# EAGLE design Bracelet_PCB_v2.0 (EAGLE 8.2.0)

## Sheet 1 of 2
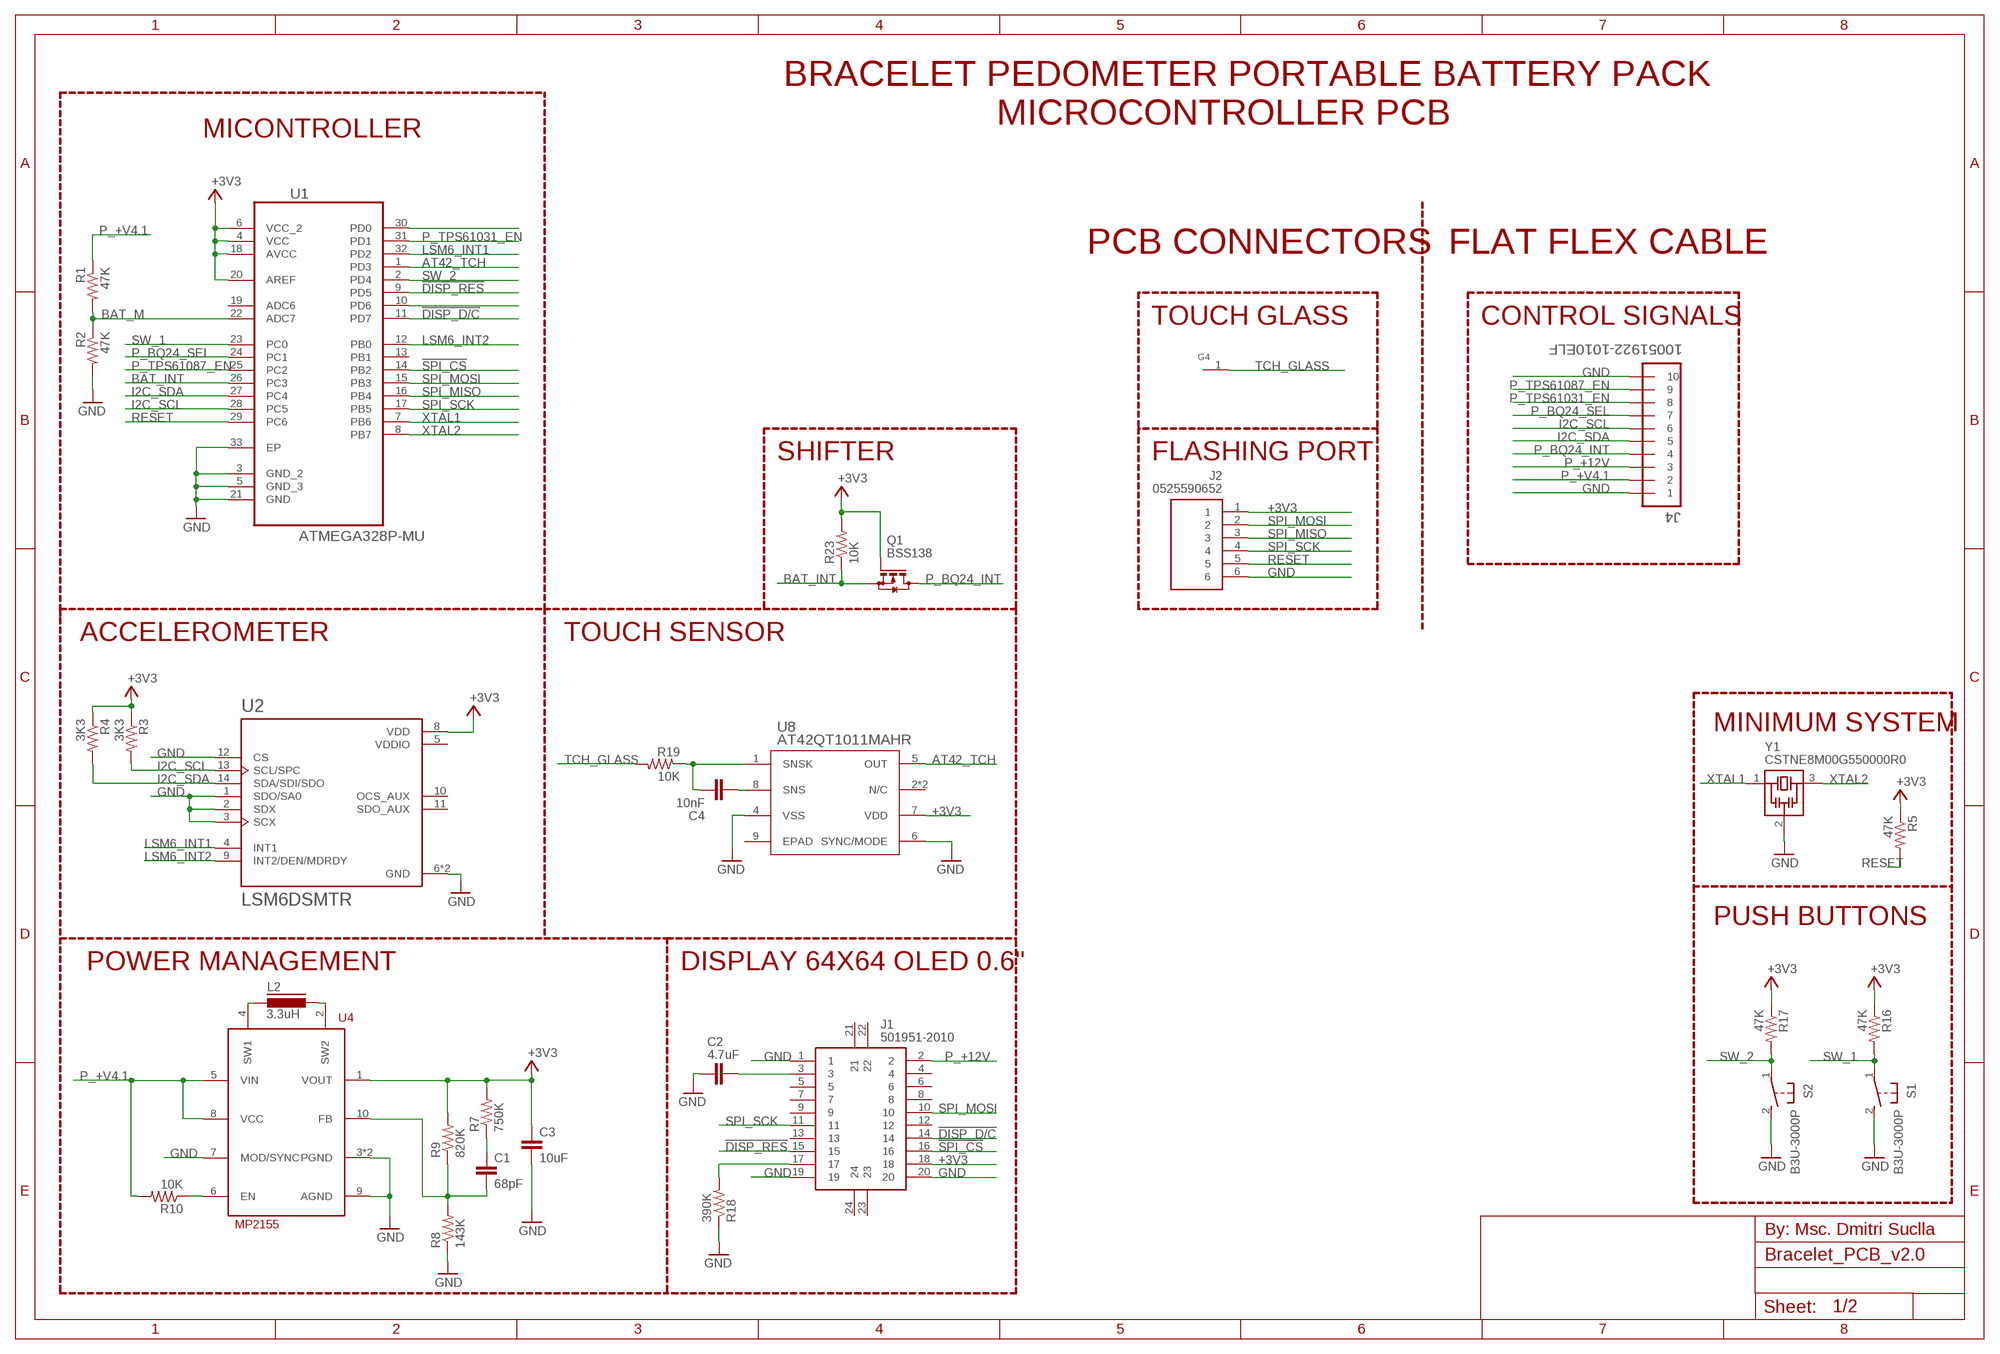
[diagram p0: schematic, sheet 1]

### Parts
C1  68pF  C-EUC0201  [C0201]
C2  4.7uF  C-EUC0402  [C0402]
C3  10uF  C-EUC0603  [C0603]
C4  10nF  C-EUC0201  [C0201]
G4  TOUCH_GLASS  [TOUCH_GLASS]
J1  501951-2010  [5019512010]
J2  0525590652  [0525590652]
J4  10051922-1010ELF  [FCI_10051922-1010ELF]
L2  3.3uH  MBKK1608T3R3M  [0603(1608)]
Q1  BSS138  [SOT23]
R1  47K  R-US_R0201  [R0201]
R2  47K  R-US_R0201  [R0201]
R3  3K3  R-US_R0201  [R0201]
R4  3K3  R-US_R0201  [R0201]
R5  47K  R-US_R0201  [R0201]
R7  750K  R-US_R0201  [R0201]
R8  143K  R-US_R0201  [R0201]
R9  820K  R-US_R0201  [R0201]
R10  10K  R-US_R0201  [R0201]
R16  47K  R-US_R0201  [R0201]
R17  47K  R-US_R0201  [R0201]
R18  390K  R-US_R0201  [R0201]
R19  10K  R-US_R0201  [R0201]
R23  10K  R-US_R0201  [R0201]
S1  B3U-3000P  [SW_B3U-3000P]
S2  B3U-3000P  [SW_B3U-3000P]
U1  ATMEGA328P-MU  [QFN50P500X500X100-33N]
U2  LSM6DSMTR  [PQFN50P300X250X86-14N]
U4  MP2155  [QFN10]
U8  AT42QT1011MAHR  [8-UDFN]
Y1  CSTNE8M00G550000R0  CSTNE  [CSTNE]

### Nets
!DISP_D/C: J1.14 U1.11(PD7)
!DISP_RES: J1.15 U1.9(PD5)
!SPI_CS: J1.16 U1.14(PB2)
+3V3 [3v3]: C3.1 J1.18 J2.1 Q1.1(G) R3.1 R4.1 R5.1 R7.2 R9.2 R16.1 R17.1 R23.2 U1.4(VCC) U1.6(VCC_2) U1.18(AVCC) U1.20(AREF) U2.8(VDD) U4.1(VOUT) U8.7(VDD)
AT42_TCH: U1.1(PD3) U8.5(OUT)
BAT_INT: Q1.2(S) R23.1 U1.26(PC3)
BAT_M: R1.2 R2.1 U1.22(ADC7)
GND: C2.2 C3.2 J1.1 J1.19 J1.20 J2.6 J4.1 J4.10 R2.2 R8.1 R18.1 S1.2 S2.2 U1.3(GND_2) U1.5(GND_3) U1.21(GND) U1.33(EP) U2.1(SDO/SA0) U2.2(SDX) U2.3(SCX) U2.6(GND) U2.7(GND) U2.12(CS) U4.3(PGND) U4.7(MOD/SYNC) U4.9(AGND) U4.EP(PGND) U8.4(VSS) U8.6(SYNC/MODE) Y1.2(GND)
I2C_SCL: J4.6 R3.2 U1.28(PC5) U2.13(SCL/SPC)
I2C_SDA: J4.5 R4.2 U1.27(PC4) U2.14(SDA/SDI/SDO)
LSM6_INT1: U1.32(PD2) U2.4(INT1)
LSM6_INT2: U1.12(PB0) U2.9(INT2/DEN/MDRDY)
N$2: C1.1 R7.1
N$4: C1.2 R8.2 R9.1 U4.10(FB)
N$5: L2.2 U4.2(SW2)
N$7: L2.1 U4.4(SW1)
N$8: C4.1 U8.8(SNS)
N$10: C2.1 J1.3
N$11: C4.2 R19.1 U8.1(SNSK)
N$12: U1.30(PD0)
N$13: U1.10(PD6)
N$22: R10.1 U4.6(EN)
N$25: J1.17 R18.2
P_+12V: J1.2 J4.3
P_+V4.1: J4.2 R1.1 R10.2 U4.5(VIN) U4.8(VCC)
P_BQ24_INT: J4.4 Q1.3(D)
P_BQ24_SEL: J4.7 U1.24(PC1)
P_TPS61031_EN: J4.8 U1.31(PD1)
P_TPS61087_EN: J4.9 U1.25(PC2)
RESET: J2.5 R5.2 U1.29(PC6)
SPI_MISO: J2.3 U1.16(PB4)
SPI_MOSI: J1.10 J2.2 U1.15(PB3)
SPI_SCK: J1.11 J2.4 U1.17(PB5)
SW_1: R16.2 S1.1 U1.23(PC0)
SW_2: R17.2 S2.1 U1.2(PD4)
TCH_GLASS: G4.1 R19.2
XTAL1: U1.7(PB6) Y1.1(IN)
XTAL2: U1.8(PB7) Y1.3(OUT)
Unconnected: J1.4 J1.5 J1.6 J1.7 J1.8 J1.9 J1.12 J1.13 J1.21 J1.22 J1.23 J1.24 U1.13(PB1) U1.19(ADC6) U2.10(OCS_AUX) U2.11(SDO_AUX) U8.2(N/C) U8.3(N/C) U8.9(EPAD)

### Notes on the sheet
- BRACELET PEDOMETER PORTABLE BATTERY PACK
- MICROCONTROLLER PCB
- MICONTROLLER
- PCB CONNECTORS | FLAT FLEX CABLE
- TOUCH GLASS | CONTROL SIGNALS
- SHIFTER | FLASHING PORT
- ACCELEROMETER | TOUCH SENSOR
- MINIMUM SYSTEM
- PUSH BUTTONS
- POWER MANAGEMENT | DISPLAY 64X64 OLED 0.6"
- By: Msc. Dmitri Suclla

## Sheet 2 of 2
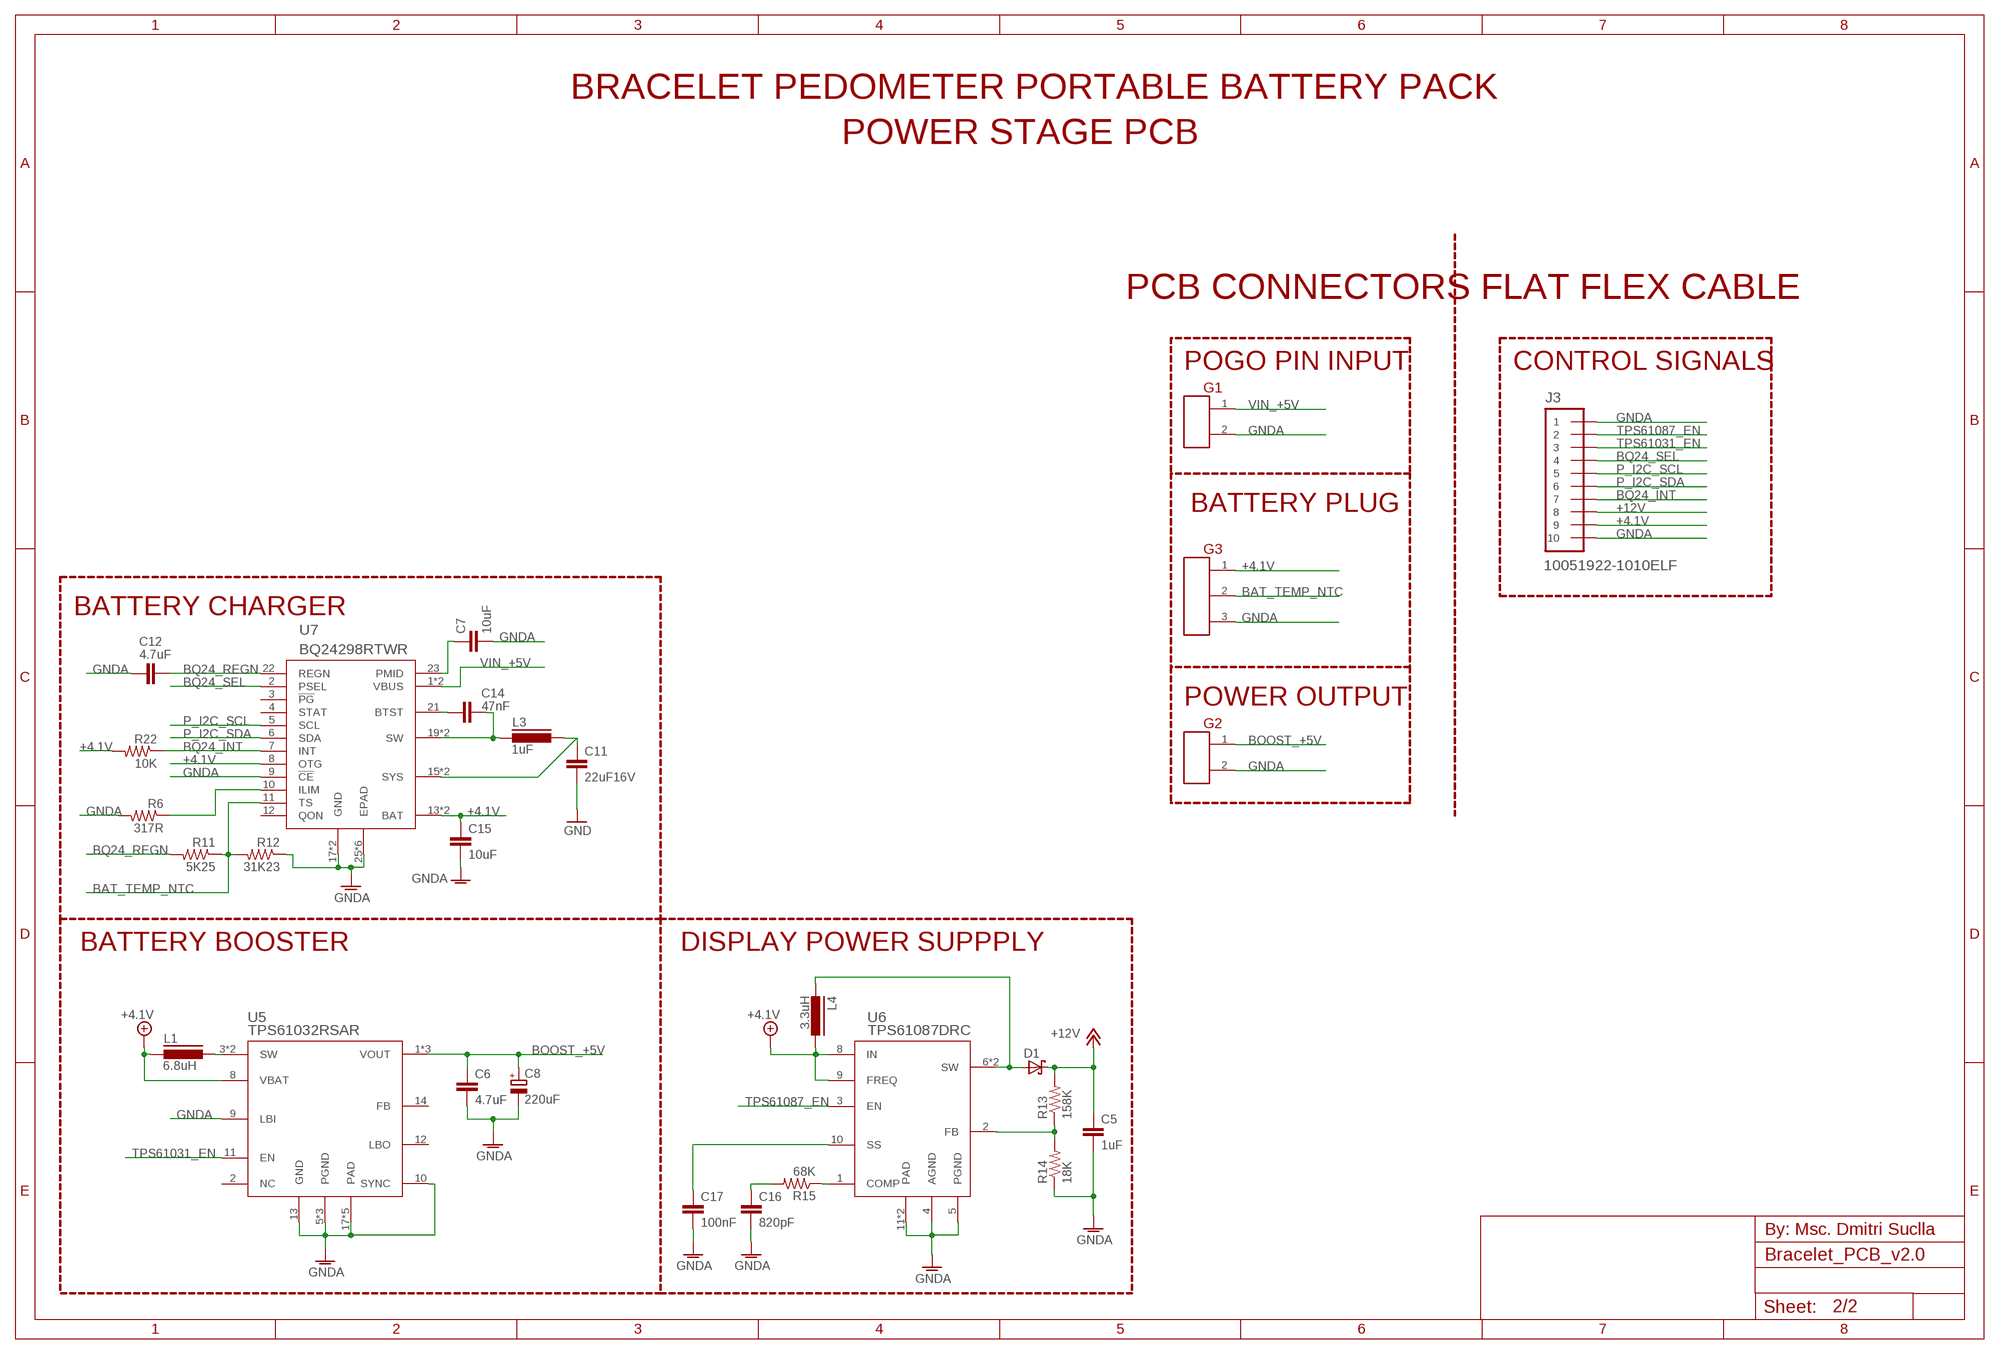
[diagram p1: schematic, sheet 2]

### Parts
C5  1uF  C-EUC0402  [C0402]
C6  4.7uF  C-EUC0402  [C0402]
C7  10uF  C-EUC0603  [C0603]
C8  220uF  CPOL-EUCT3528  [CT3528]
C11  22uF16V  C-EUC1206  [C1206]
C12  4.7uF  C-EUC0402  [C0402]
C14  47nF  C-EUC0201  [C0201]
C15  10uF  C-EUC0603  [C0603]
C16  820pF  C-EUC0201  [C0201]
C17  100nF  C-EUC0201  [C0201]
D1  CDBU0245CDBU-M  [CDBU-M]
G1  PIN_HEADER  [PIN_HEADER_2P_1.27MM]
G2  PIN_HEADER  [PIN_HEADER_2P_1.27MM]
G3  PIN_HEADER_3  [PIN_HEADER_3P]
J3  10051922-1010ELF  [FCI_10051922-1010ELF]
L1  6.8uH  SRP50306R8M  [SRP5030]
L3  1uF  DFE252012PD-1R0M=P2  [DFE252012PD]
L4  3.3uH  MBKK1608T3R3M  [0603(1608)]
R6  317R  R-US_R0201  [R0201]
R11  5K25  R-US_R0201  [R0201]
R12  31K23  R-US_R0201  [R0201]
R13  158K  R-US_R0201  [R0201]
R14  18K  R-US_R0201  [R0201]
R15  68K  R-US_R0201  [R0201]
R22  10K  R-US_R0201  [R0201]
U5  TPS61032RSAR  TPS6103XRSAR  [16-VQFN]
U6  TPS61087DRC  [10-VSON]
U7  BQ24298RTWR  [VQFN]

### Nets
+4.1V [4v1]: C15.1 G3.1 J3.9 L1.2 L4.2 R22.2 U5.8(VBAT) U6.8(IN) U6.9(FREQ) U7.8(OTG) U7.13(BAT) U7.14(BAT)
+12V: C5.1 D1.C J3.8 R13.2
BAT_TEMP_NTC: G3.2 R11.1 R12.2 U7.11(TS)
BOOST_+5V [5v]: C6.1 C8.+ G2.1 U5.1(VOUT) U5.15(VOUT) U5.16(VOUT)
BQ24_INT: J3.7 R22.1 U7.7(INT)
BQ24_REGN: C12.1 R11.2 U7.22(REGN)
BQ24_SEL: J3.4 U7.2(PSEL)
GNDA: C5.2 C6.2 C7.2 C8.- C11.2 C12.2 C15.2 C16.2 C17.2 G1.2 G2.2 G3.3 J3.1 J3.10 R6.2 R12.1 R14.1 U5.5(PGND) U5.6(PGND) U5.7(PGND) U5.9(LBI) U5.10(SYNC) U5.13(GND) U5.17(PAD) U5.19(PAD) U5.20(PAD) U5.21(PAD) U5.22(PAD) U6.4(AGND) U6.5(PGND) U6.11(PAD) U6.Y(PAD) U7.9(!CE) U7.17(GND) U7.18(GND) U7.25(EPAD) U7.G1(EPAD) U7.G2(EPAD) U7.G3(EPAD) U7.G4(EPAD) U7.G5(EPAD) ; supply symbol labelled GND
N$1: R6.1 U7.10(ILIM)
N$3 [4v1]: C14.1 L3.1 U7.19(SW) U7.20(SW)
N$6: C14.2 U7.21(BTST)
N$9: C7.1 U7.23(PMID)
N$14: D1.A L4.1 U6.6(SW) U6.7(SW)
N$15 [4v1]: L1.1 U5.3(SW) U5.4(SW)
N$16: R13.1 R14.2 U6.2(FB)
N$19: R15.1 U6.1(COMP)
N$20: C16.1 R15.2
N$21: C17.1 U6.10(SS)
N$29 [4v1]: C11.1 L3.2 U7.15(SYS) U7.16(SYS)
P_I2C_SCL: J3.5 U7.5(SCL)
P_I2C_SDA: J3.6 U7.6(SDA)
TPS61031_EN: J3.3 U5.11(EN)
TPS61087_EN: J3.2 U6.3(EN)
VIN_+5V [5v]: G1.1 U7.1(VBUS) U7.24(VBUS)
Unconnected: U5.2(NC) U5.12(LBO) U5.14(FB) U7.3(!PG) U7.4(STAT) U7.12(QON)

### Notes on the sheet
- BRACELET PEDOMETER PORTABLE BATTERY PACK
- POWER STAGE PCB
- PCB CONNECTORS | FLAT FLEX CABLE
- POGO PIN INPUT | CONTROL SIGNALS
- BATTERY PLUG
- BATTERY CHARGER
- POWER OUTPUT
- BATTERY BOOSTER | DISPLAY POWER SUPPPLY
- By: Msc. Dmitri Suclla

## Power pins joined to a net without a drawn wire
VDDIO: U2.5(VDDIO)

## Library data of the parts
C1 = rcl:C-EU: CAPACITOR, European symbol; MF: Murata; MPN: GRM0335C1H680JA01D
C2 C6 C12 = rcl:C-EU: CAPACITOR, European symbol; MF: Samsung; MFP: CL05A475MO5NUNC
C3 C7 C15 = rcl:C-EU: CAPACITOR, European symbol; MF: Murata; MPN: GRM188R61C106KAALJ
C4 = rcl:C-EU: CAPACITOR, European symbol; MF: Murata; MPN: GRM033R61E103MA12D
C5 = rcl:C-EU: CAPACITOR, European symbol; MF: Samsung; MPN: CL05A105KA5NQNC
C8 = rcl:CPOL-EU: POLARIZED CAPACITOR, European symbol; MF: AVX; MPN: F930J227MBA
C11 = rcl:C-EU: CAPACITOR, European symbol; MFP: CC1206ZKY5V7BB226
C14 = rcl:C-EU: CAPACITOR, European symbol; MF: Murata; MFP: GRM033R61C473KE84D
C16 = rcl:C-EU: CAPACITOR, European symbol; MF: Murata; MPN: CL03A104KO3NNNC
C17 = rcl:C-EU: CAPACITOR, European symbol; MF: Samsung; MPN: CL03A104KO3NNNC
D1 = Comchip Tech:CDBU0245: CDBU0245-HF Io = 200 mA VR = 45 Volts RoHS Device Halogen Free; MF: Comchip; MPN: CDBU0245
G1 G2 = User_Lib:PIN_HEADER
G3 = User_Lib:PIN_HEADER_3
G4 = User_Lib:TOUCH_GLASS
J1 = 501951-2010:501951-2010: MOLEX - 501951-2010. - CONNECTOR, FPC, RCPT, 20POS, 2ROW Source: Datasheet <https://www.molex.com/pdm_docs/sd/5019512010_sd.pdf>; DESCRIPTION: MOLEX - 501951-2010. - CONNECTOR, FPC, RCPT, 20POS, 2ROW; HEIGHT: mm; MANUFACTURER_NAME: Molex; MANUFACTURER_PART_NUMBER: 501951-2010; MOUSER_PART_NUMBER: 538-501951-2010; MOUSER_PRICE-STOCK: https://www.mouser.co.uk/ProductDetail/Molex/501951-2010?qs=1uvhzzitxfi4%252BEtokmanpw%3D%3D
J2 = 501951-2010:0525590652: FFC CABLE CONNECTOR; MF: Molex; MPN: 0525590652
J3 J4 = Amphenol ICC:10051922-: FFC/FPC CONNECTOR, 10POS, 1ROW; DESCRIPTION: 10 Position FPC Connector Contacts, Bottom 0.020 (0.50mm) Surface Mount, Right Angle; MF: Amphenol ICC; MPN: 10051922-1010ELF
L1 = Bourns_inductors:SRP5030: BOURNS high saturation current Inductors Inductance range: 0.33 to 15 µH https://www.bourns.com/docs/Product-Datasheets/SRP5030T.pdf; MF: Bourns; MPN: SRP5030T-6R8M
L2 L4 = Taiyo Yauden:MBKK1608: Inductor Power Chip Wirewound MCOIL MB Series; MF: Taiyo Yuden; MP: MBKK1608T3R3M; PACKAGE: 1608 Taiyo Yuden
L3 = Murata:DFE252012PD: FIXED IND 1UH 3.2A 42 MOHM SMD; DESCRIPTION: Inductor Tol. +/-20%, Package: 1008 (2520); MF: Murata Electronics; MP: DFE252012PD-1R0M=P2; PACKAGE: 2520 Murata
Q1 = transistor-small-signal:BSS138
R1-R12 R14-R19 R22 = rcl:R-US_: RESISTOR, American symbol
R13 R23 = rcl:R-US_: RESISTOR, American symbol; MF: Panasonic; MPN: ERJ-1GNF1583C
S1 S2 = Omron:B3U-3000P: Switch Tactile N.O. SPST Button Gull Wing 0.05A 12VDC 1.59N SMD Embossed T/R; DESCRIPTION: Tactile Switch SPST-NO Side Actuated Surface Mount, Right Angle; MF: Omron Electronics; MP: B3U-3000P
U1 = Atmel_By_element14_Batch_1-00:ATMEGA328P-MU: Programmable Flash; MPN: ATMEGA328P-MU; OC_FARNELL: 1748522; OC_NEWARK: 26R2526; PACKAGE: QFN-32; SUPPLIER: Atmel
U2 = LSM6DSMTR:LSM6DSMTR: iNEMO inertial module: 3D accelerometer and 3D gyroscope; DESCRIPTION: Accelerometer, Gyroscope, Temperature, 6 Axis Sensor I²C, SPI Output; DIGI-KEY_PART_NUMBER: 497-16696-1-ND; MF: STMicroelectronics; MP: LSM6DSMTR; PACKAGE: VFLGA-14 STMicroelectronics
U4 = User_Lib:MP2155: High Efficiency Single Inductor Buck-Boost Converter 2.2A.
U5 = Texas Instruments:TPS6103X; MF: Texas Instruments; MPN: TPS61032RSAR
U6 = Texas Instruments:TPS61087: The TPS61087 is a high-frequency, high-efficiency DC-DC converter with an integrated 3.2-A, 0.13-Ω power switch capable of providing an output voltage up to 18.5 V. The selectable frequency of 650 kHz or 1.2 MHz allows the use of small external inductors and capacitors and provides fast transient response. The external compensation allows optimization of the application for specific conditions. A capacitor connected to the soft-start pin minimizes inrush current at startup.; MF: Texas Instruments; PARTNUMBER: TPS61087DRCR
U7 = Texas Instruments:BQ24298: The bq24298 is a highly-integrated switch-mode battery charge management and system power path management device for 1 cell Li-Ion and Li-polymer battery in a wide range of smart phone and tablet applications. Its low impedance power path optimizes switch-mode operation efficiency, reduces battery charging time and extends battery life during discharging phase; MF: Texas Instruments; MPN: BQ24298RTWR
U8 = Microchip:AT42QT1011; MF: Microchip; MPN: AT42QT1011-MAHR
Y1 = CERALOCK_CSTCE:CSTNE: Ceramic Resonator 3-Pin CSMD T/R; DESCRIPTION: Ceramic Resonator Built in Capacitor 15pF ±0.3% -20°C ~ 80°C Surface Mount; MF: Murata; MP: CSTNE

## Net classes
0 default: width 0.254 mm
1 5v: width 0.635 mm, drill 0.35 mm
2 4v1: width 0.635 mm, drill 0.35 mm
3 3v3: width 0.254 mm

## Board
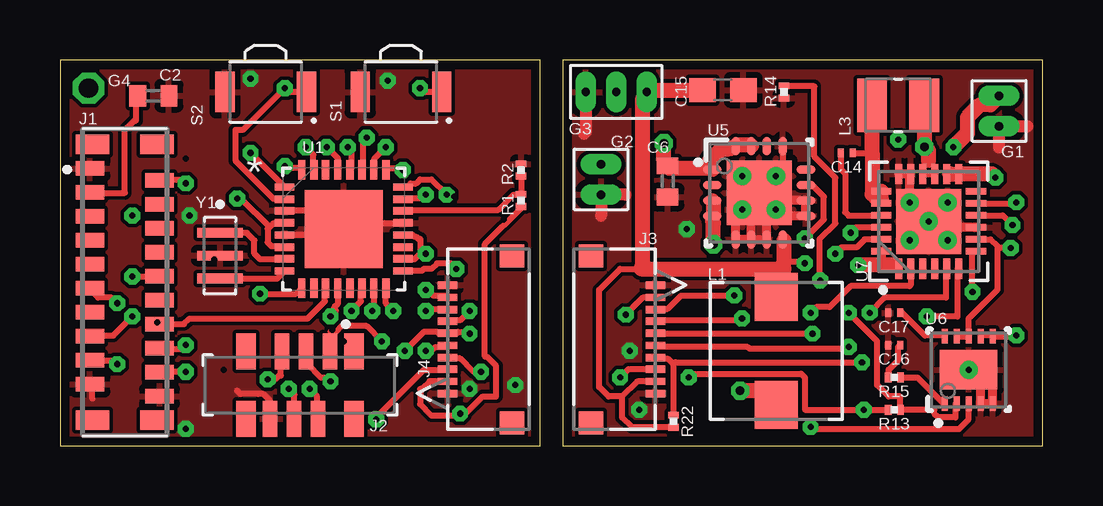
[diagram p2: board, top side]
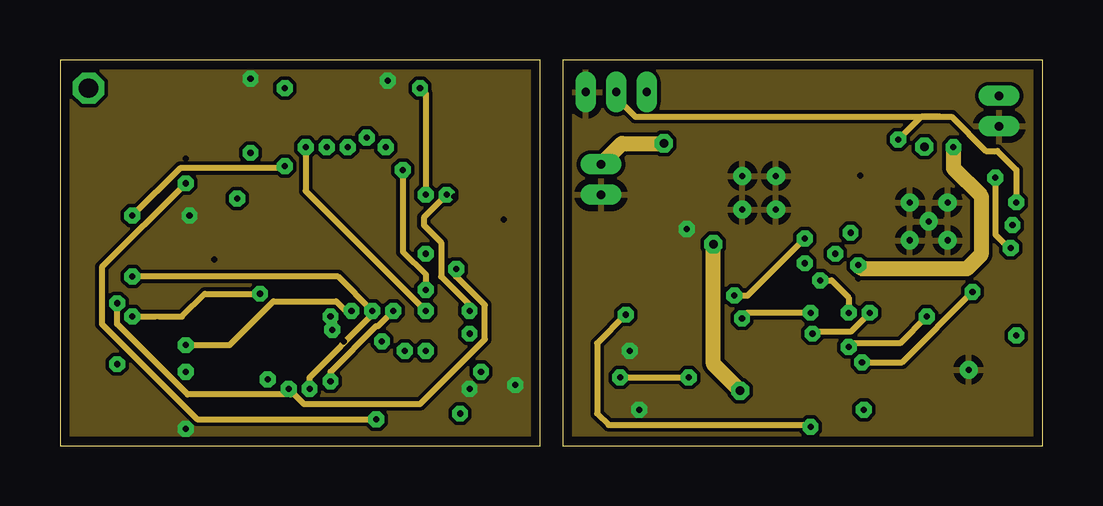
[diagram p3: board, inner layer Route2]
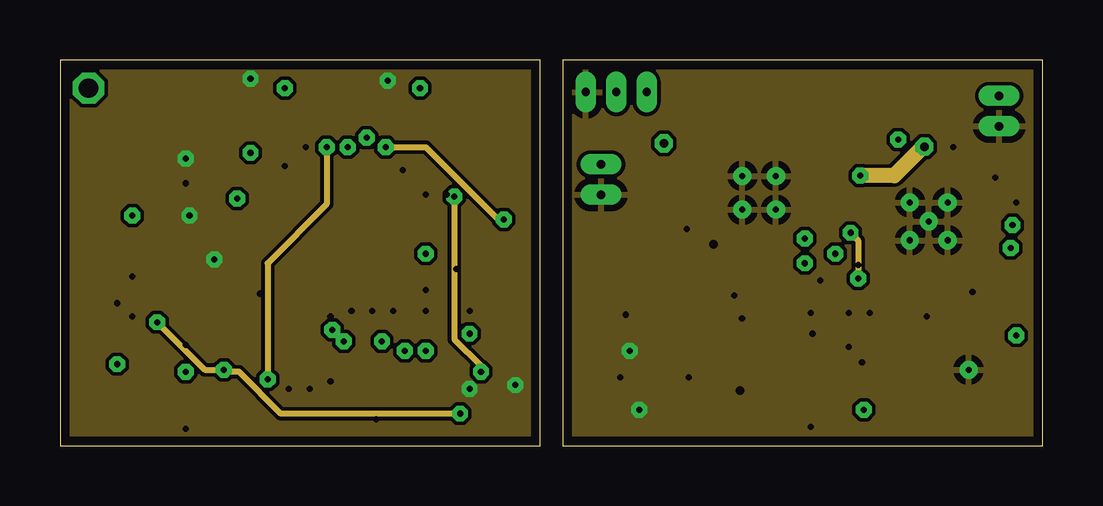
[diagram p4: board, inner layer Route15]
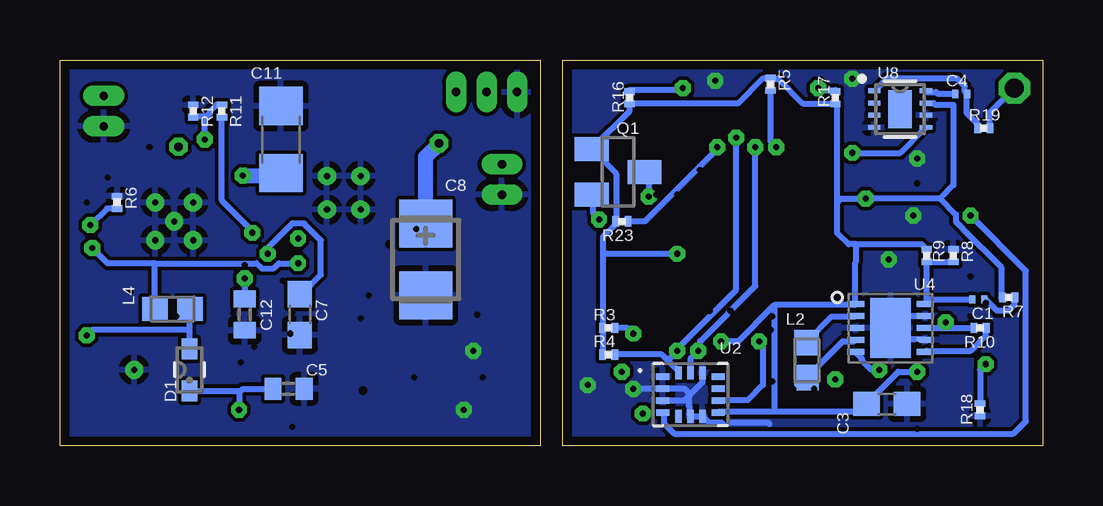
[diagram p5: board, bottom side, seen from below]

Size 40.95 x 16.1 mm. Coordinates in mm from the lower left corner, seen from the top.
Outline: 0,0 20,0 20,16.1 0,16.1 0,0
Outline: 20.95,0 40.95,0 40.95,16.1 20.95,16.1 20.95,0
Copper layers [2:(1+(2*15)+16):15]: Top 0.07mm / dielectric 0.2mm / Route2 0.05mm / dielectric 0.15mm / Route15 0.05mm / dielectric 0.2mm / Bottom 0.07mm
Design rules "default *": minimum track width 8mil, minimum drill 10mil, track to track 6mil, track to pad 6mil, pad to pad 6mil, via to via 6mil, smd to smd 6mil, copper to edge 15mil, drill to drill 10mil, minimum pad ring 10mil, minimum via ring 8mil, stop-mask expansion 4mil, vias tented up to drill 0mil, thermal gap 10mil

### Footprints (pad centres in the part's own frame; a part is rotated, then mirrored left to right if it is on the bottom)
C0201 = smd 0.25 x 0.35: 1 -0.25,0; 2 0.25,0
C0402 = smd 0.7 x 0.9: 1 -0.65,0; 2 0.65,0
C0603 = smd 1.1 x 1: 1 -0.85,0; 2 0.85,0
CT3528 = smd 2 x 2.2: + -1.5,0; - 1.5,0
C1206 = smd 1.6 x 1.8: 1 -1.4,0; 2 1.4,0
CDBU-M = smd 0.864 x 0.66: A 0.876,0; C -0.876,0
PIN_HEADER_2P_1.27MM = drill 0.35 long: 1 -0.635,0; 2 0.635,0
PIN_HEADER_3P = drill 0.35 long: 1 -1.27,0; 2 0,0; 3 1.27,0
TOUCH_GLASS = drill 0.8 octagon: 1 0,0
5019512010 = smd 0.6 x 1.2: 1 -4.75,-1.45; 2 -4.25,1.45; 3 -3.75,-1.45; 4 -3.25,1.45; 5 -2.75,-1.45; 6 -2.25,1.45; 7 -1.75,-1.45; 8 -1.25,1.45; 9 -0.75,-1.45; 10 -0.25,1.45; 11 0.25,-1.45; 12 0.75,1.45; 13 1.25,-1.45; 14 1.75,1.45; 15 2.25,-1.45; 16 2.75,1.45; 17 3.25,-1.45; 18 3.75,1.45; 19 4.25,-1.45; 20 4.75,1.45 | smd 0.8 x 1.4: 21 -5.75,-1.35; 22 -5.75,1.35; 23 5.75,1.35; 24 5.75,-1.35
0525590652 = smd 0.6 x 1.5: 1 -1.25,-1.4; 2 -0.75,1.4; 3 -0.25,-1.4; 4 0.25,1.4; 5 0.75,-1.4; 6 1.25,1.4 | smd 0.8 x 1.5: A -2.25,-1.4; B -2.25,1.4; C 2.25,1.4; D 2.25,-1.4
FCI_10051922-1010ELF = smd 0.305 x 0.813: 1 2.261,-1.791; 2 1.753,-1.791; 3 1.245,-1.791; 4 0.762,-1.791; 5 0.254,-1.791; 6 -0.254,-1.791; 7 -0.762,-1.791; 8 -1.245,-1.791; 9 -1.753,-1.791; 10 -2.261,-1.791 | smd 0.965 x 1.016: 11 -3.48,0.902; 12 3.48,0.902
SRP5030 = smd 2 x 1.8: 1 -2.25,0; 2 2.25,0
0603(1608) = smd 1.06 x 1.02: 1 -0.728,0; 2 0.728,0
DFE252012PD = smd 1.24 x 2.22: 1 -1.09,0; 2 1.09,0
SOT23 = smd 1 x 1.4: 1 -0.95,-1.1; 2 0.95,-1.1; 3 0,1.1
R0201 = smd 0.28 x 0.43: 1 -0.255,0; 2 0.255,0
SW_B3U-3000P = smd 0.8 x 1.7: 1 -1.7,0; 2 1.7,0
QFN50P500X500X100-33N = smd 0.813 x 0.305: 1 -2.464,1.753; 2 -2.464,1.245; 3 -2.464,0.762; 4 -2.464,0.254; 5 -2.464,-0.254; 6 -2.464,-0.762; 7 -2.464,-1.245; 8 -2.464,-1.753; 17 2.464,-1.753; 18 2.464,-1.245; 19 2.464,-0.762; 20 2.464,-0.254; 21 2.464,0.254; 22 2.464,0.762; 23 2.464,1.245; 24 2.464,1.753 | smd 0.305 x 0.813: 9 -1.753,-2.464; 10 -1.245,-2.464; 11 -0.762,-2.464; 12 -0.254,-2.464; 13 0.254,-2.464; 14 0.762,-2.464; 15 1.245,-2.464; 16 1.753,-2.464; 25 1.753,2.464; 26 1.245,2.464; 27 0.762,2.464; 28 0.254,2.464; 29 -0.254,2.464; 30 -0.762,2.464; 31 -1.245,2.464; 32 -1.753,2.464 | smd 3.251 x 3.251: 33 0,0
PQFN50P300X250X86-14N = smd 0.55 x 0.26: 1 -1.16,0.75; 2 -1.16,0.25; 3 -1.16,-0.25; 4 -1.16,-0.75; 8 1.16,-0.75; 9 1.16,-0.25; 10 1.16,0.25; 11 1.16,0.75 | smd 0.26 x 0.55: 5 -0.5,-0.91; 6 0,-0.91; 7 0.5,-0.91; 12 0.5,0.91; 13 0,0.91; 14 -0.5,0.91
QFN10 = smd 0.7 x 0.25: 1 -1.45,1; 2 -1.45,0.5; 3 -1.45,0; 4 -1.45,-0.5; 5 -1.45,-1; 6 1.45,-1; 7 1.45,-0.5; 8 1.45,0; 9 1.45,0.5; 10 1.45,1 | smd 1.7 x 2.5: EP 0,0
16-VQFN = smd 0.78 x 0.35: 1 -1.95,0.975; 2 -1.95,0.325; 3 -1.95,-0.325; 4 -1.95,-0.975; 9 1.95,-0.975; 10 1.95,-0.325; 11 1.95,0.325; 12 1.95,0.975 | smd 0.35 x 0.78: 5 -0.975,-1.95; 6 -0.325,-1.95; 7 0.325,-1.95; 8 0.975,-1.95; 13 0.975,1.95; 14 0.325,1.95; 15 -0.325,1.95; 16 -0.975,1.95 | smd 2.7 x 2.7: 17 0,0 | drill 0.254: 19 -0.7,0.7; 20 -0.7,-0.7; 21 0.7,-0.7; 22 0.7,0.7
10-VSON = smd 0.6 x 0.24: 1 -1.4,1; 2 -1.4,0.5; 3 -1.4,0; 4 -1.4,-0.5; 5 -1.4,-1; 6 1.4,-1; 7 1.4,-0.5; 8 1.4,0; 9 1.4,0.5; 10 1.4,1 | smd 1.65 x 2.4: 11 0,0 | drill 0.254: Y 0,0
VQFN = smd 0.85 x 0.28: 1 -1.975,1.25; 2 -1.975,0.75; 3 -1.975,0.25; 4 -1.975,-0.25; 5 -1.975,-0.75; 6 -1.975,-1.25; 13 1.975,-1.25; 14 1.975,-0.75; 15 1.975,-0.25; 16 1.975,0.25; 17 1.975,0.75; 18 1.975,1.25 | smd 0.28 x 0.85: 7 -1.25,-1.975; 8 -0.75,-1.975; 9 -0.25,-1.975; 10 0.25,-1.975; 11 0.75,-1.975; 12 1.25,-1.975; 19 1.25,1.975; 20 0.75,1.975; 21 0.25,1.975; 22 -0.25,1.975; 23 -0.75,1.975; 24 -1.25,1.975 | smd 2.7 x 2.7: 25 0,0 | drill 0.254 pad 0.508: G1 -0.787,0.787; G2 0.787,0.787; G3 0,0; G4 -0.787,-0.787; G5 0.787,-0.787
8-UDFN = smd 0.508 x 0.203: 1 -1.079,0.762; 2 -1.079,0.254; 3 -1.079,-0.254; 4 -1.079,-0.762; 5 1.079,-0.762; 6 1.079,-0.254; 7 1.079,0.254; 8 1.079,0.762 | smd 0.991 x 1.6: 9 0,0
CSTNE = smd 0.4 x 1.9: 1 -0.95,0; 2 0,0; 3 0.95,0

### Placement (x,y rotation side)
C1  2.7,6.11 180 bottom
C2  3.89,14.61 0 top
C3  6.51,1.75 0 bottom
C4  3.41,14.68 0 bottom
C5  31.43,2.38 0 bottom
C6  25.32,11.03 270 top
C7  30.96,5.48 270 bottom
C8  25.72,7.78 270 bottom
C11  31.75,12.78 90 bottom
C12  33.26,5.48 270 bottom
C14  32.78,12.22 180 top
C15  27.62,14.84 0 top
C16  34.77,4.21 180 top
C17  34.77,5.56 180 top
D1  35.56,3.17 90 bottom
G1  39.13,13.97 270 top
G2  22.54,11.11 270 top
G3  23.18,14.76 180 top
G4  1.19,14.92 0 top
J1  2.7,6.83 270 top
J2  10,2.54 180 top
J3  23.02,4.45 90 top
J4  17.94,4.45 270 top
L1  29.84,3.97 90 top
L2  9.84,3.57 90 bottom
L3  34.92,14.21 0 top
L4  36.27,5.71 180 bottom
Q1  17.7,11.43 270 bottom
R1  19.21,10.24 90 top
R2  19.21,11.51 90 top
R3  18.1,4.92 0 bottom
R4  18.1,3.81 0 bottom
R5  11.35,15.08 270 bottom
R6  38.58,10.16 90 bottom
R7  1.43,6.19 180 bottom
R8  3.73,7.94 270 bottom
R9  4.84,7.94 90 bottom
R10  2.62,4.92 180 bottom
R11  34.21,13.97 270 bottom
R12  35.4,13.97 270 bottom
R13  34.77,1.51 180 top
R14  30.16,14.76 90 top
R15  34.77,2.86 180 top
R16  17.22,14.53 90 bottom
R17  8.65,14.53 90 bottom
R18  2.62,1.51 90 bottom
R19  2.46,13.26 0 bottom
R22  25.56,1.03 270 top
R23  17.54,9.37 180 bottom
S1  14.21,14.76 180 top
S2  8.57,14.76 180 top
U1  11.83,9.05 0 top
U2  14.68,2.14 0 bottom
U4  6.35,4.92 0 bottom
U5  29.13,10.56 0 top
U6  37.86,3.17 90 top
U7  36.2,9.37 90 top
U8  5.95,14.05 0 bottom
Y1  6.67,7.94 270 top

### Tracks (layer width: path | path; a pad name or v marks a point on that pad's centre or on a via)
!DISP_D/C
  Top 0.254: U1.11 11.03,6.51 11.03,6.03 10.32,5.32 5.4,5.32 5.16,5.08 4.21,5.08 J1.14
!DISP_RES  (via drill 0.25 layers 1-2)
  Top 0.254: v8.33,6.35 9.84,6.35 10,6.51 U1.9 | v3.02,5.4 2.22,4.6 1.27,4.6 J1.15
  Route2 0.254: v8.33,6.35 6.03,6.35 5.08,5.4 v3.02,5.4
!SPI_CS  (via drill 0.25 layers 1-2)
  Top 0.254: v12.14,5.64 12.54,6.03 12.54,6.51 U1.14 | v5.24,4.21 5.08,4.05 4.21,4.05 J1.16
  Route2 0.254: v12.14,5.64 11.91,5.64 11.51,6.03 8.89,6.03 7.06,4.21 v5.24,4.21
+3V3  (via drill 0.25)
  Top 0.254: 15,8.02 14.76,7.78 14.37,7.78 U1.18 | 15,8.02 15,8.65 14.92,8.65 14.84,8.73 14.76,8.73 14.68,8.81 14.37,8.81 U1.20 | v15.24,8.02 15,8.02 | v5.24,3.1 4.21,3.1 J1.18 | 8.65,9.05 8.65,8.49 8.81,8.33 9.29,8.33 U1.6 | 8.73,9.13 8.89,9.29 9.29,9.29 U1.4 | 8.73,9.13 8.65,9.05 | v13.41,4.37 12.78,5 11.75,5 11.51,4.76 11.27,4.76 11.27,3.97 J2.1 | 8.65,9.21 8.65,9.05 | 8.73,9.13 7.54,10.32 v7.38,10.32
  Bottom 0.254: R4.1 18.34,3.81 18.34,4.92 R3.1 18.34,5 18.34,8.02 | 18.34,8.02 18.34,8.73 17.78,9.29 R23.2 17.78,9.37 17.78,11.35 18.73,12.3 Q1.1 18.73,12.46 17.22,13.97 R16.1 17.14,14.29 12.7,14.29 11.67,15.32 11.43,15.32 R5.1 11.35,15.32 11.03,15.32 10,14.29 8.65,14.29 R17.1 8.57,14.21 8.57,10.16 | 18.34,8.02 v15.24,8.02 | 11.19,1.43 7.7,1.43 7.38,1.75 C3.1 7.3,1.83 6.03,3.1 v5.24,3.1 | 11.19,1.43 13.49,1.43 U2.8 | R7.2 1.75,6.19 1.75,7.46 3.33,9.05 3.33,9.06 3.63,9.35 3.63,9.66 4.29,10.32 | v13.41,4.37 12.7,4.37 11.27,5.79 | 11.27,5.79 11.19,5.87 7.86,5.87 U4.1 7.82,5.94 7.82,7.66 7.78,7.7 7.78,8.41 | 11.19,1.43 11.19,5.71 11.27,5.79 | 8.57,10.16 8.41,10.32 v7.38,10.32 4.29,10.32 | R9.2 5.06,8.41 7.78,8.41 | 7.78,8.41 8.1,8.41 8.57,8.89 8.57,10.16 | U8.7 4.56,14.3 4.49,14.23 3.73,14.23 3.73,10.87 4.29,10.32
+4.1V  (via drill 0.25, 0.25 layers 1-2)
  Top 0.254: J3.9 24.04,2.69 23.42,2.06 | R22.2 25.54,0.79 23.81,0.79 23.42,1.19 23.42,2.06 | 39.05,8.33 39.05,6.51 37.86,5.32 U6.8 U6.9 | U7.8 38.77,8.62 39.05,8.33 | 23.42,2.06 22.86,2.06 22.46,2.46 22.46,6.51 23.34,7.38 24.21,7.38 | v39.61,8.26 39.13,8.26 39.05,8.33 | 30.16,7.7 30.96,7.7 v31.04,7.62 | U5.8 30.13,8.61 30.16,8.57
  Top 0.381: U7.14 37.1,11.34
  Top 0.635: C15.1 24.53,14.84 G3.1 24.29,14.53 24.29,7.62 24.21,7.38 30.16,7.38 | 30.16,7.38 30.16,6.59 29.84,6.27 L1.2 | 30.16,7.38 30.16,7.7 30.16,8.57 | v38.97,11.19 38.82,11.34 U7.13 37.1,11.34
  Route2 0.254: v39.61,8.26 39.53,8.33 39.45,8.33 38.97,8.81 v38.97,11.19
  Bottom 0.254: 36.99,5.71 L4.2 37,7.61 36.99,7.62 | v39.61,8.26 38.97,7.62 36.99,7.62 | 36.99,7.62 32.77,7.62 32.56,7.41 32.05,7.41 31.84,7.62 v31.04,7.62
+12V  (via drill 0.25, 0.25 layers 1-2)
  Top 0.254: R13.2 v33.5,1.51 31.04,1.51 31.04,2.86 30.88,3.02 26.19,3.02 v26.19,2.86 | 24.77,3.17 J3.8 23.68,3.2 v23.34,2.86
  Route2 0.254: v23.34,2.86 v26.19,2.86
  Bottom 0.254: C5.1 33.34,2.38 33.42,2.3 | 33.42,2.3 33.5,2.22 v33.5,1.51 | D1.C 33.42,2.3
AT42_TCH  (via drill 0.25)
  Top 0.254: v7.94,12.22 9.29,10.87 U1.1
  Bottom 0.254: v7.94,12.22 5.95,12.22 4.92,13.26 U8.5
BAT_INT  (via drill 0.25, 0.25 layers 15-16)
  Top 0.254: v13.57,12.46 13.1,11.99 13.1,11.59 U1.26
  Route15 0.254: v18.49,9.45 18.26,9.45 15.24,12.46 v13.57,12.46
  Bottom 0.254: R23.1 16.59,9.37 13.57,12.38 v13.57,12.46 | v18.49,9.45 18.73,9.68 18.73,10.48 Q1.2
BAT_M
  Top 0.254: R2.1 R1.2 19.13,10.48 18.89,10.48 18.26,9.84 14.37,9.84 U1.22
BAT_TEMP_NTC  (via drill 0.25, 0.25 layers 1-2)
  Top 0.254: U7.11 39.8,10.12 v39.85,10.16
  Route2 0.254: G3.2 23.18,14.53 23.97,13.73 35.8,13.73 | v39.85,10.16 39.85,11.51 39.05,12.3 38.58,12.3 37.15,13.73 35.8,13.73 | 36.67,13.73 35.88,13.73 35.8,13.65 | 35.8,13.65 v34.92,12.78 | 35.8,13.65 35.8,13.73
  Bottom 0.254: 34.85,13.73 34.7,13.87 34.7,13.97 34.45,14.22 R11.1 | 34.85,13.73 35.38,13.73 R12.2 | v34.92,12.78 34.92,13.65 34.85,13.73
BOOST_+5V  (via drill 0.35)
  Top 0.635: U5.15 28.73,12.54 28.18,12.54 U5.16 27.86,12.38 27.54,12.38 27.07,11.91 27.15,11.59 | 27.15,11.59 25.4,11.59 25.32,11.67 C6.1 25.16,11.91 v25.16,12.62 | 27.15,11.59 U5.1
  Route2 0.635: G2.1 23.42,12.62 v25.16,12.62
  Bottom 0.635: C8.+ 25.72,12.06 v25.16,12.62
BQ24_INT  (via drill 0.25 layers 1-2)
  Top 0.254: 25.56,3.41 R22.1 | 25.56,3.41 25.32,3.65 24.84,3.65 J3.7 | v38.02,6.43 38.02,8.02 38.1,8.1 U7.7 | v33.42,3.49 25.64,3.49 25.56,3.41
  Route2 0.254: v38.02,6.43 35.08,3.49 v33.42,3.49
BQ24_REGN  (via drill 0.25, 0.25 layers 15-16)
  Top 0.254: U7.22 33.17,9.12 v32.94,8.89
  Route15 0.254: v33.26,6.99 33.26,8.57 v32.94,8.89
  Bottom 0.254: R11.2 34.21,10.24 32.94,8.97 v32.94,8.89 | v33.26,6.99 C12.1
BQ24_SEL  (via drill 0.25 layers 1-2)
  Top 0.254: v28.42,5.32 28.42,5.24 24.84,5.24 J3.4 | v31.27,5.56 31.51,5.79 32.07,5.79 32.94,6.67 35.4,6.67 35.45,6.71 U7.2
  Route2 0.254: v28.42,5.32 28.65,5.56 v31.27,5.56
GND  (via drill 0.25, 0.25 layers 1-2, 0.25 layers 15-16)
  Top 0.254: U1.5 9.37,8.81 11.59,8.81 U1.33 11.83,9.13 | U1.3 9.39,9.84 11.11,9.84 11.83,9.13 | U1.21 14.28,9.29 12.86,9.29 12.7,9.13 11.83,9.13 | J2.6 8.75,1.89 8.47,2.17 8.27,2.17 7.51,2.17 7.38,2.3 | 1.35,1.98 1.35,2.48 J1.19
  Bottom 0.254: v17.07,2.38 15.88,2.38 U2.2 14.93,2.39 14.68,2.14 | U4.7 4.92,4.45 6.19,4.45 6.35,4.6 U4.EP 6.35,5.16 6.11,5.4 4.92,5.4 U4.9 | U2.3 14.93,1.89 14.68,2.14 | 14.68,2.14 14.76,2.14 14.76,1.68 14.73,1.65 14.73,1.28 U2.6 14.16,1.23 13.91,0.98 13.67,0.98 13.66,0.97 13.55,0.98 11.46,0.98 11.39,0.91 | U2.12 14.18,2.64 14.68,2.14
  other vias: 5.4,9.6 6.43,7.78 5.24,0.71 18.97,2.54 13.65,15.24 7.94,15.32 5.24,11.99
  pour Top: 0,16.1 0,0 20,0 20,16.1
  pour Bottom: 20,16.1 20,0 0,0 0,16.1
  pour Route2: 20,16.1 20,0 0,0 0,16.1
  pour Route15: 20,16.1 20,0 0,0 0,16.1
GNDA  (via drill 0.25, 0.25 layers 1-2)
  Top 0.254: U5.17 U5.21 | U5.13 30.11,11.53 U5.22
  Top 0.381: 35.41,11.34 U7.18 | 35.41,11.34 35.41,11.36 | 35.41,11.34 U7.G2 | U5.6 28.81,9.48 U5.20 28.16,9.58 U5.5 U5.6 | U5.6 U5.7 29.46,9.48 U5.21 30.21,10.23 U5.10 U5.9 30.11,9.58 | U7.9 37.52,9.12 U7.G4 | U6.4 38.36,2.88 38.66,3.17 38.86,2.97 U6.5 U6.4
  Top 0.508: G3.3 21.91,13.1 21.83,13.02 | 23.57,10.48 G2.2 22.54,9.6 | 39.13,12.46 G1.2 40.32,13.34
  Top 0.635: U5.21 30.11,9.58
  other vias: 24.13,1.51 23.73,3.97 26.11,9.05
  pour Top: 20.95,16.1 20.95,0 40.96,0 40.96,16.1
  pour Route2: 40.96,16.1 40.96,0 20.95,0 20.95,16.1
  pour Route15: 40.96,16.11 40.96,0 20.95,0 20.95,16.11
  pour Bottom: 40.96,16.11 40.96,0 20.95,0 20.95,16.11
I2C_SCL  (via drill 0.25)
  Top 0.254: v17.07,4.68 16.99,4.76 16.59,4.76 16.51,4.68 16.19,4.68 J4.6 16.03,4.68 15.8,4.68 15.72,4.76 15.16,4.76 v14.37,3.97 | v11.99,12.46 12.14,12.46 12.14,11.59 U1.28
  Bottom 0.254: R3.2 17.3,4.92 v17.07,4.68 | U2.13 14.68,3.65 v14.37,3.97 14.29,4.05 14.29,4.37 11.99,6.67 v11.99,12.46
I2C_SDA  (via drill 0.25)
  Top 0.254: v15.24,3.97 15.48,3.97 15.64,4.13 16.11,4.13 J4.5 | v12.78,12.86 12.62,12.86 12.62,11.59 U1.27
  Bottom 0.254: R4.2 15.88,3.81 15.64,3.57 | 15.64,3.57 15.16,3.1 U2.14 | 15.64,3.57 v15.24,3.97 15.24,4.05 12.78,6.51 v12.78,12.86
LSM6_INT1  (via drill 0.25, 0.25 layers 1-2)
  Top 0.254: v9.37,11.67 9.45,11.59 10,11.59 U1.32
  Route2 0.254: v3.02,9.6 5,11.59 9.29,11.59 v9.37,11.67
  Bottom 0.254: v3.02,9.6 0.71,7.3 0.71,1.03 1.24,0.51 15.35,0.51 15.8,0.95 15.8,1.35 U2.4
LSM6_INT2  (via drill 0.25 layers 1-2, 0.25 layers 15-16, 0.25 layers 2-15)
  Top 0.254: v11.27,5.4 11.51,5.64 11.43,5.71 11.43,5.79 11.59,5.95 11.59,6.51 U1.12
  Route2 0.254: v11.27,5.4 11.43,5.24 11.43,4.92 v11.35,4.84
  Route15 0.254: v11.83,4.37 v11.35,4.84
  Bottom 0.254: v11.83,4.37 11.67,4.21 11.67,2.54 12.3,1.91 13.49,1.91 U2.9
N$1  (via drill 0.25)
  Top 0.254: U7.10 39.28,9.62 v39.69,9.21
  Bottom 0.254: R6.1 38.99,9.9 v39.69,9.21
N$2
  Bottom 0.254: C1.1 2.38,6.11 1.91,5.64 1.43,5.64 1.19,5.87 1.19,6.19 R7.1
N$3
  Top 0.254: C14.1 33.84,12.22
  Top 0.635: L3.1 33.84,12.22 33.84,10.5 | 33.84,10.5 34.06,10.28 | 34.22,10.29 U7.19 34.1,10.5 33.84,10.5
N$4
  Bottom 0.254: C1.2 4.68,6.11 4.84,5.95 U4.10 4.84,5.98 R9.1 R8.2
N$5
  Bottom 0.254: U4.2 7.86,5.4 8.81,5.4 9.84,4.37 L2.2
N$6
  Top 0.254: C14.2 32.53,11.54 32.71,11.36 32.71,9.75 32.86,9.6 34.21,9.6 U7.21
N$7
  Bottom 0.254: U4.4 7.86,4.37 8.33,4.37 9.84,2.86 L2.1
N$8
  Bottom 0.254: C4.1 4.37,14.68 4.45,14.76 4.84,14.76 U8.8
N$9  (via drill 0.25)
  Top 0.254: U7.23 33.53,8.62 33.19,8.28 32.57,8.28 v32.31,8.02
  Bottom 0.254: 31.01,6.27 C7.1 30.88,6.35 30.08,7.14 30.08,8.57 30.8,9.29 31.27,9.29 32.31,8.26 v32.31,8.02
N$10
  Top 0.254: C2.1 3.17,14.61 3.17,13.57 3.1,13.57 2.7,13.18 2.7,10.56 1.27,10.56 J1.3
N$11
  Bottom 0.254: U8.1 6.99,14.84 6.51,15.32 3.57,15.32 3.25,15 3.25,14.76 C4.2 3.17,14.68 3.17,13.89 2.72,13.43 R19.1
N$14  (via drill 0.25)
  Top 0.254: U6.7 38.42,4.6 38.81,4.6 U6.6 39.82,4.58 v39.85,4.6
  Bottom 0.254: 35.56,4.84 L4.1 | 35.56,4.84 D1.A | 35.56,4.84 39.61,4.84 v39.85,4.6
N$15  (via drill 0.35 layers 1-2)
  Top 0.635: U5.3 27.23,10.16 27.23,9.6 U5.4 27.23,9.29 v27.23,8.41 | v28.34,2.3 29.29,2.3 29.84,1.75 L1.1
  Route2 0.635: v27.23,8.41 27.23,3.41 v28.34,2.3
N$16  (via drill 0.25 layers 1-2)
  Top 0.254: U6.2 37.31,1.75 37.31,1.19 36.59,1.19 36.43,1.35 36.43,1.51 R13.1 35,1.59 35,2.06 34.53,2.06 34.05,2.54 34.05,4.37 v32.86,5.56 | R14.2 30.16,15 31.43,15 31.43,12.06 32.31,11.19 32.31,9.29 31.64,8.63 31.64,6.93 v31.67,6.91
  Route2 0.254: v32.86,5.56 32.86,6.19 32.15,6.91 v31.67,6.91
N$19
  Top 0.254: U6.1 36.83,1.75 35.72,2.86 R15.1
N$20
  Top 0.254: C16.1 35,4.21 34.92,4.13 34.92,3.57 34.53,3.17 34.53,2.86 R15.2
N$21
  Top 0.254: C17.1 35.08,5.56 36.04,4.6 36.83,4.6 U6.10
N$22
  Bottom 0.254: R10.1 2.38,4.92 2.38,4.6 3.02,3.97 4.84,3.97 U4.6
N$25  (via drill 0.25)
  Top 0.254: v2.38,3.41 2.22,3.57 1.27,3.57 J1.17
  Bottom 0.254: R18.2 2.62,3.17 v2.38,3.41
N$29  (via drill 0.25 layers 15-16, 0.35)
  Top 0.254: 35.95,11.66 U7.16 U7.15 36.45,11.66 36.2,11.91 35.95,11.66
  Top 0.635: 36.2,11.91 36.2,12.3 v36.02,12.48 L3.2
  Route15 0.635: v36.02,12.48 35.98,12.48 34.77,11.27 v33.34,11.27
  Bottom 0.635: v33.34,11.27 31.86,11.27 C11.1
P_+12V  (via drill 0.25 layers 1-2)
  Top 0.254: v13.18,1.11 13.18,1.19 15.16,3.17 16.11,3.17 J4.3 | v5.24,10.95 5.08,11.11 4.21,11.11 J1.2
  Route2 0.254: v13.18,1.11 5.71,1.11 1.75,5.08 1.75,7.46 v5.24,10.95
P_+V4.1  (via drill 0.25, 0.25 layers 15-16)
  Top 0.254: 16.67,1.27 15.48,1.27 15,1.75 15,2.38 15.08,2.38 15.4,2.7 16.11,2.7 J4.2 | 16.67,1.27 16.83,1.27 17.62,2.06 18.18,2.06 18.18,3.33 17.78,3.73 17.7,3.73 17.7,8.41 19.21,9.92 R1.1 | v16.67,1.35 16.67,1.27
  Route15 0.254: v4.05,5.16 6.03,3.17 v6.83,3.17 6.91,3.1 7.46,3.1 9.21,1.35 v16.67,1.35
  Bottom 0.254: U4.8 4.05,4.92 | 4.05,4.92 R10.2 | v6.83,3.17 7.14,3.17 7.54,3.57 7.54,3.65 7.78,3.89 U4.5 | 4.05,4.92 v4.05,5.16
P_BQ24_INT  (via drill 0.25, 0.25 layers 15-16)
  Top 0.254: v17.54,3.1 17.22,3.1 16.67,3.65 16.19,3.65 J4.4
  Route15 0.254: v17.54,3.1 17.54,3.33 16.43,4.45 v16.43,10.4
  Bottom 0.254: v16.43,10.4 16.43,11.27 16.59,11.43 Q1.3
P_BQ24_SEL  (via drill 0.25 layers 1-2)
  Top 0.254: v17.07,5.64 16.67,5.24 16.19,5.24 J4.7 | v16.11,10.48 15.48,11.11 15,11.11 14.84,10.95 14.61,10.95 14.45,10.79 14.37,10.79 U1.24
  Route2 0.254: v17.07,5.64 17.07,5.87 15.88,7.06 15.88,8.49 15.16,9.21 15.16,9.53 v16.11,10.48
P_I2C_SCL  (via drill 0.25 layers 1-2)
  Top 0.254: v31.35,4.68 24.84,4.68 J3.5 | v33.73,5.56 34.37,6.19 36.91,6.19 36.91,7.38 U7.5
  Route2 0.254: v31.35,4.68 31.43,4.76 32.94,4.76 v33.73,5.56
P_I2C_SDA  (via drill 0.25 layers 1-2)
  Top 0.254: v32.86,4.13 32.86,4.05 28.73,4.05 28.65,4.13 24.84,4.13 J3.6 | v36.12,5.4 37.39,5.4 37.39,7.38 U7.6
  Route2 0.254: v32.86,4.13 33.02,4.29 35,4.29 v36.12,5.4
P_TPS61031_EN  (via drill 0.25 layers 1-2)
  Top 0.254: v15.24,5.64 15.32,5.64 15.4,5.71 16.11,5.71 J4.8 | v10.24,12.46 10.56,12.14 10.56,11.59 U1.31
  Route2 0.254: v15.24,5.64 10.24,10.64 v10.24,12.46
P_TPS61087_EN  (via drill 0.25 layers 1-2)
  Top 0.254: v15.24,6.51 15.32,6.51 15.56,6.27 16.11,6.27 J4.9 | v14.29,11.51 14.21,11.59 13.65,11.59 U1.25
  Route2 0.254: v15.24,6.51 15.24,7.14 14.29,8.1 v14.29,11.51
RESET  (via drill 0.25)
  Top 0.254: v11.11,12.46 11.59,11.99 11.59,11.59 U1.29 | v8.65,2.78 8.97,2.78 9.13,2.94 9.21,2.94 9.21,3.89 J2.5
  Route15 0.254: v8.65,2.78 8.65,7.62 11.11,10.08 v11.11,12.46
  Bottom 0.254: R5.2 11.35,12.7 v11.11,12.46
SPI_MISO  (via drill 0.25 layers 1-2)
  Top 0.254: v13.89,5.64 13.57,5.95 13.57,6.51 U1.16 | v11.27,2.7 11.11,2.86 10.87,2.86 10.32,3.41 10.32,3.89 J2.3
  Route2 0.254: v13.89,5.64 13.26,5 13.18,5 11.27,3.1 v11.27,2.7
SPI_MOSI  (via drill 0.25 layers 1-2)
  Top 0.254: v13.02,5.64 13.1,5.64 13.1,6.51 U1.15 | v10.4,2.38 10.72,2.06 10.72,1.19 J2.2 | v3.02,7.06 4.13,7.06 J1.10
  Route2 0.254: v10.4,2.38 10.4,2.86 13.02,5.48 v13.02,5.64 11.59,7.06 v3.02,7.06
SPI_SCK  (via drill 0.25 layers 1-2)
  Top 0.254: v16.51,7.38 16.27,7.62 15.72,7.62 15.48,7.38 15.16,7.38 15.08,7.3 14.37,7.3 U1.17 | v9.53,2.38 9.76,2.14 9.76,1.19 J2.4 | v2.38,5.95 2.14,6.19 1.59,6.19 1.27,6.51 J1.11
  Route2 0.254: v16.51,7.38 16.51,7.06 17.7,5.87 17.7,4.45 15,1.75 10.16,1.75 v9.53,2.38 9.6,2.14 5.32,2.14 2.38,5.08 v2.38,5.95
SW_1  (via drill 0.25, 0.25 layers 1-2)
  Top 0.254: v15,14.92 15.16,14.76 S1.1 | v15.24,10.48 15.08,10.32 14.37,10.32 U1.23
  Route2 0.254: v15.24,10.48 15.24,14.68 v15,14.92
  Bottom 0.254: v15,14.92 15.08,14.84 17.22,14.84 R16.2
SW_2  (via drill 0.25)
  Top 0.254: S2.1 9.53,14.76 v9.37,14.92 7.62,13.18 7.3,13.18 7.3,11.91 8.89,10.32 9.29,10.32 U1.2
  Bottom 0.254: v9.37,14.92 9.29,14.84 8.65,14.84 R17.2
TCH_GLASS
  Bottom 0.254: R19.2 2.21,13.91 G4.1
TPS61031_EN  (via drill 0.25, 0.25 layers 1-2)
  Top 0.254: v31.04,8.65 31.83,9.45 31.83,10.4 31.35,10.87 31.11,10.87 U5.11 | v28.1,6.27 25.88,6.27 25.32,5.71 24.84,5.71 J3.3
  Route2 0.254: v31.04,8.65 28.65,6.27 v28.1,6.27
TPS61087_EN  (via drill 0.25 layers 1-2)
  Top 0.254: U6.3 37.86,1.11 37.47,0.71 31.35,0.71 v31.27,0.79 | v23.57,5.48 24.29,6.19 24.77,6.19 J3.2
  Route2 0.254: v23.57,5.48 22.38,4.29 22.38,1.35 22.86,0.87 31.19,0.87 v31.27,0.79
VIN_+5V  (via drill 0.25 layers 1-2)
  Top 0.381: U7.24 34.22,7.54 | U7.1 34.79,7.54
  Top 0.635: v37.23,12.46 37.8,13.04 37.8,13.71 38.33,14.23 38.76,14.23 G1.1 | v33.26,7.54 34.22,7.54 34.79,7.54
  Route2 0.635: v37.23,12.46 37.23,11.59 38.38,10.44 38.38,7.98 37.78,7.38 33.42,7.38 v33.26,7.54
XTAL1
  Top 0.254: U1.7 9.34,7.78 8.33,7.78 8.1,8.02 8.1,8.57 7.78,8.89 Y1.1
XTAL2
  Top 0.254: U1.8 9.29,7.22 9.05,6.99 Y1.3